# Altium project RP2040-FPV.PrjPcb
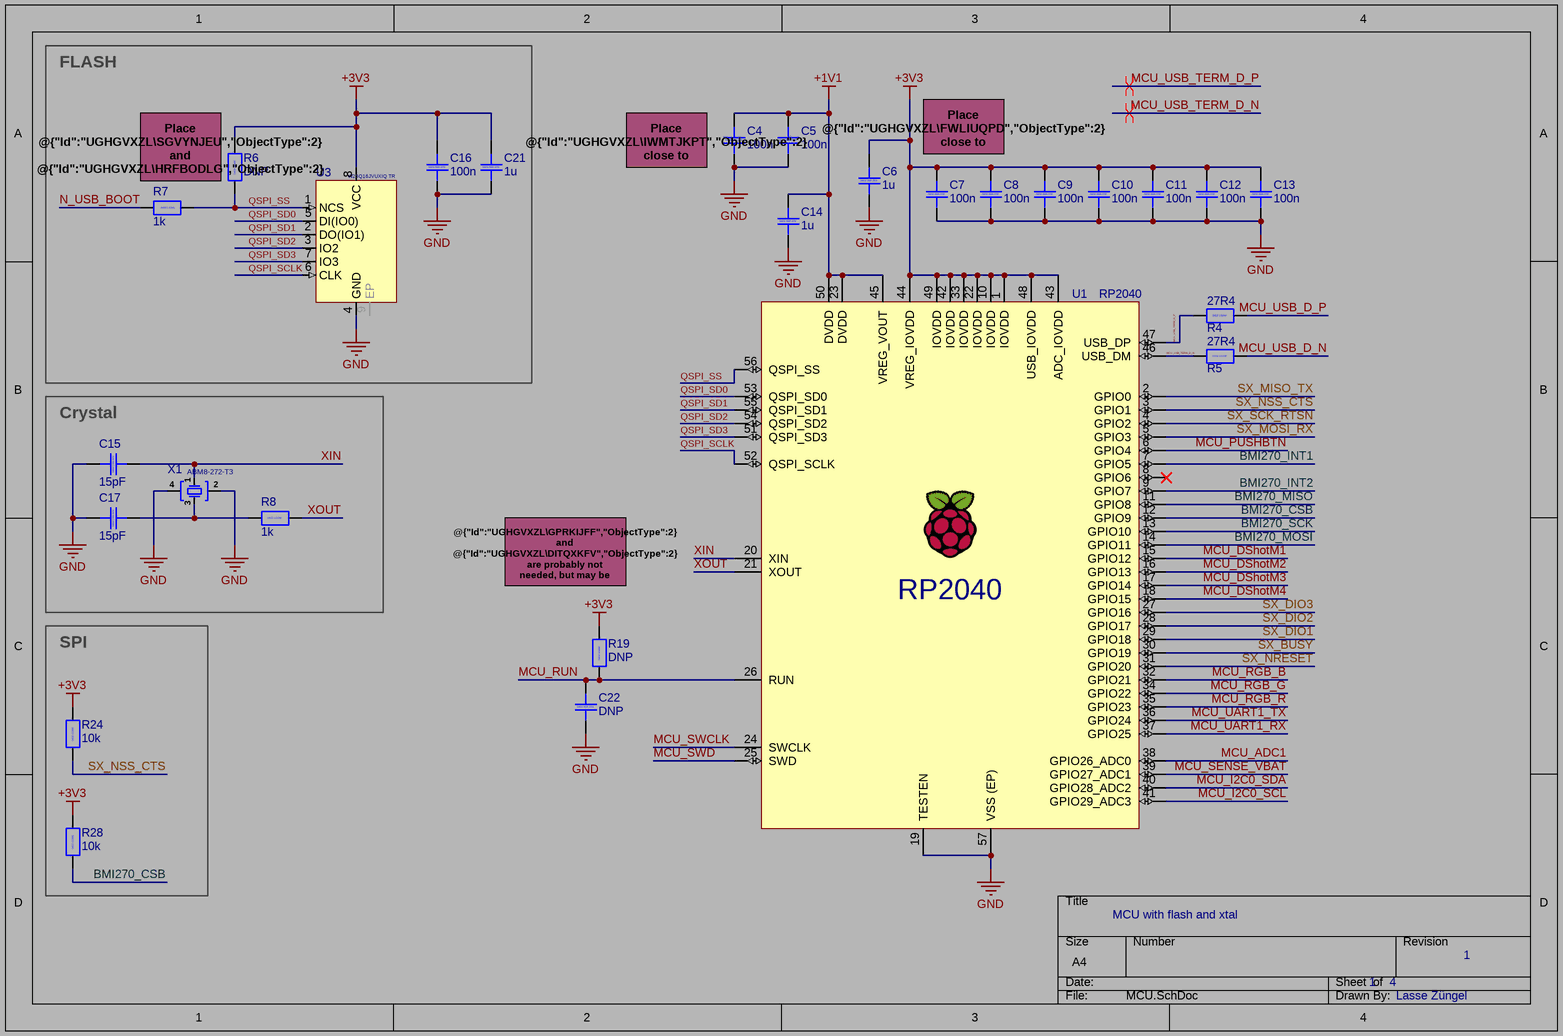
[diagram p0: MCU.SchDoc]
4 sheets, 86 parts. Net scope: global (net labels, ports and power ports of the same name join across sheets).
Board file: PCB.PcbDoc
Sheets:
  MCU.SchDoc
  Interfacing.SchDoc
  Power.SchDoc
  RF.SchDoc

## Sheet MCU.SchDoc
size A4; SheetNumber: 1; SheetTotal: 4

### Parts
C4  100n  [CAP_0402]
C5  100n  [CAP_0402]
C6  1u  [CAP_0402]
C7  100n  [CAP_0402]
C8  100n  [CAP_0402]
C9  100n  [CAP_0402]
C10  100n  [CAP_0402]
C11  100n  [CAP_0402]
C12  100n  [CAP_0402]
C13  100n  [CAP_0402]
C14  1u  [CAP_0402]
C15  15pF  [CAP_0402]
C16  100n  [CAP_0402]
C17  15pF  [CAP_0402]
C21  1u  [CAP_0402]
C22  DNP  [CAP_0402]
R4  27R4  [RES_0402]
R5  27R4  [RES_0402]
R6  DNP  [RES_0402]
R7  1k  [RES_0402]
R8  1k  [RES_0402]
R19  DNP  [RES_0402]
R24  10k  [RES_0402]
R28  10k  [RES_0402]
U1  RP2040  [QFN56 7x7 RP2040]
U3  W25Q16JVUXIQ TR  [USON-8 - 2x3]
X1  ABM8-272-T3  [ABM8-272-T3]

### Blocks framed on the sheet
FLASH: C16 C21 R6 R7 U3
Crystal: C15 C17 R8 X1
SPI: R24 R28

### Nets
+1V1: C4.2 C5.2 C14.2 U1.23(DVDD) U1.45(VREG_VOUT) U1.50(DVDD)
+3V3: C6.2 C7.2 C8.2 C9.2 C10.2 C11.2 C12.2 C13.2 C16.2 C21.2 R6.2 R19.2 R24.2 R28.2 U1.1(IOVDD) U1.10(IOVDD) U1.22(IOVDD) U1.33(IOVDD) U1.42(IOVDD) U1.43(ADC_IOVDD) U1.44(VREG_IOVDD) U1.48(USB_IOVDD) U1.49(IOVDD) U3.8(VCC)
GND: C4.1 C5.1 C6.1 C7.1 C8.1 C9.1 C10.1 C11.1 C12.1 C13.1 C14.1 C15.2 C16.1 C17.2 C21.1 C22.1 U1.19(TESTEN) U1.57(VSS_(EP)) U3.4(GND) X1.2 X1.4
BMI270_CSB: R28.1 U1.12(GPIO9)
BMI270_INT1: U1.7(GPIO5)
BMI270_INT2: U1.9(GPIO7)
BMI270_MISO: U1.11(GPIO8)
BMI270_MOSI: U1.14(GPIO11)
BMI270_SCK: U1.13(GPIO10)
MCU_ADC1: U1.38(GPIO26_ADC0)
MCU_DShotM1: U1.15(GPIO12)
MCU_DShotM2: U1.16(GPIO13)
MCU_DShotM3: U1.17(GPIO14)
MCU_DShotM4: U1.18(GPIO15)
MCU_I2C0_SCL: U1.41(GPIO29_ADC3)
MCU_I2C0_SDA: U1.40(GPIO28_ADC2)
MCU_PUSHBTN: U1.6(GPIO4)
MCU_RGB_B: U1.32(GPIO21)
MCU_RGB_G: U1.34(GPIO22)
MCU_RGB_R: U1.35(GPIO23)
MCU_RUN: C22.2 R19.1 U1.26(RUN)
MCU_SENSE_VBAT: U1.39(GPIO27_ADC1)
MCU_SWCLK: U1.24(SWCLK)
MCU_SWD: U1.25(SWD)
MCU_UART1_RX: U1.37(GPIO25)
MCU_UART1_TX: U1.36(GPIO24)
MCU_USB_D_N: R5.2
MCU_USB_D_P: R4.2
MCU_USB_TERM_D_N: R5.1 U1.46(USB_DM)
MCU_USB_TERM_D_P: R4.1 U1.47(USB_DP)
N_USB_BOOT: R7.2
QSPI_SCLK: U1.52(QSPI_SCLK) U3.6(CLK)
QSPI_SD0: U1.53(QSPI_SD0) U3.5(DI(IO0))
QSPI_SD1: U1.55(QSPI_SD1) U3.2(DO(IO1))
QSPI_SD2: U1.54(QSPI_SD2) U3.3(IO2)
QSPI_SD3: U1.51(QSPI_SD3) U3.7(IO3)
QSPI_SS: R6.1 R7.1 U1.56(QSPI_SS) U3.1(NCS)
SX_BUSY: U1.30(GPIO19)
SX_DIO1: U1.29(GPIO18)
SX_DIO2: U1.28(GPIO17)
SX_DIO3: U1.27(GPIO16)
SX_MISO_TX: U1.2(GPIO0)
SX_MOSI_RX: U1.5(GPIO3)
SX_NRESET: U1.31(GPIO20)
SX_NSS_CTS: R24.1 U1.3(GPIO1)
SX_SCK_RTSN: U1.4(GPIO2)
XIN: C15.1 U1.20(XIN) X1.1
XOUT: R8.2 U1.21(XOUT)
NetC17_1: C17.1 R8.1 X1.3

Not connected (* = marked no-connect by the designer): U1 8(GPIO6)*; U3 9(EP)

### Layout directives
differential pair; differential pair class DIFFPAIRUSBMCU: MCU_USB_TERM_D_N, MCU_USB_TERM_D_P

### Notes on the sheet
- (near R6) Place @{"Id":"UGHGVXZL\SGVYNJEU","ObjectType":2} and @{"Id":"UGHGVXZL\HRFBODLG","ObjectType":2} close to @{"Id":"UGHGVXZL\OZXAQZFD","ObjectType":2} pin 1.
- (near C4) Place @{"Id":"UGHGVXZL\IWMTJKPT","ObjectType":2} close to @{"Id":"UGHGVXZL\TVPMBQHX","ObjectType":2} pin 45.
- Place @{"Id":"UGHGVXZL\FWLIUQPD","ObjectType":2} close to @{"Id":"UGHGVXZL\TVPMBQHX","ObjectType":2} pin 44.
- @{"Id":"UGHGVXZL\GPRKIJFF","ObjectType":2} and @{"Id":"UGHGVXZL\DITQXKFV","ObjectType":2} are probably not needed, but may be added in case of spurrious resets.
- MCU with flash and xtal
- 1    4
- 1
- Lasse Züngel
- (in symbol CAP_0402_C0G_50V) 0402 C0G 50V
- (in symbol CAP_0402_X5R_25V) 0402 X5R 25V
- (in symbol RES_0402) 0402 1/16W

### Library data of the parts
C4-C14 C16 C21 C22 = CAP_0402_X5R_25V: Capacitor 0402 generic, X5R, 25V
C15 C17 = CAP_0402_C0G_50V: Capacitor 0402 generic, C0G (NP0), 50V
R4-R8 R19 R24 R28 = RES_0402: Resistor 0402 generic, 1/16W
U1 = RP2040: SC0914(13) / ARM Microcontrollers - MCU IC RP2040 (RP2B2) T&R, 3,400 (13" reel) UICC01104
U3 = W25Q16JVUXIQ TR: FLASH - NOR Memory IC 16Mbit SPI - Quad I/O 133 MHz 6 ns 8-USON (2x3)
X1 = ABM8-272-T3: Crystals Ultra Miniature Ceramic SMD Crystal / 12MHz 10pF 30PPM 3.2mm x 2.5mm 50R; ComponentLink1Description: Datasheet; ComponentLink1URL: https://www.mouser.de/datasheet/2/122/ECX_1637B-1633271.pdf; ComponentLink2Description: Product Detail; ComponentLink2URL: https://eu.mouser.com/ProductDetail/ECS/ECS-320-8-37B-CKY-TR?qs=l7cgNqFNU1jF5E15eCxZkA%3D%3D

## Sheet Interfacing.SchDoc
size A4; SheetNumber: 2; SheetTotal: 4
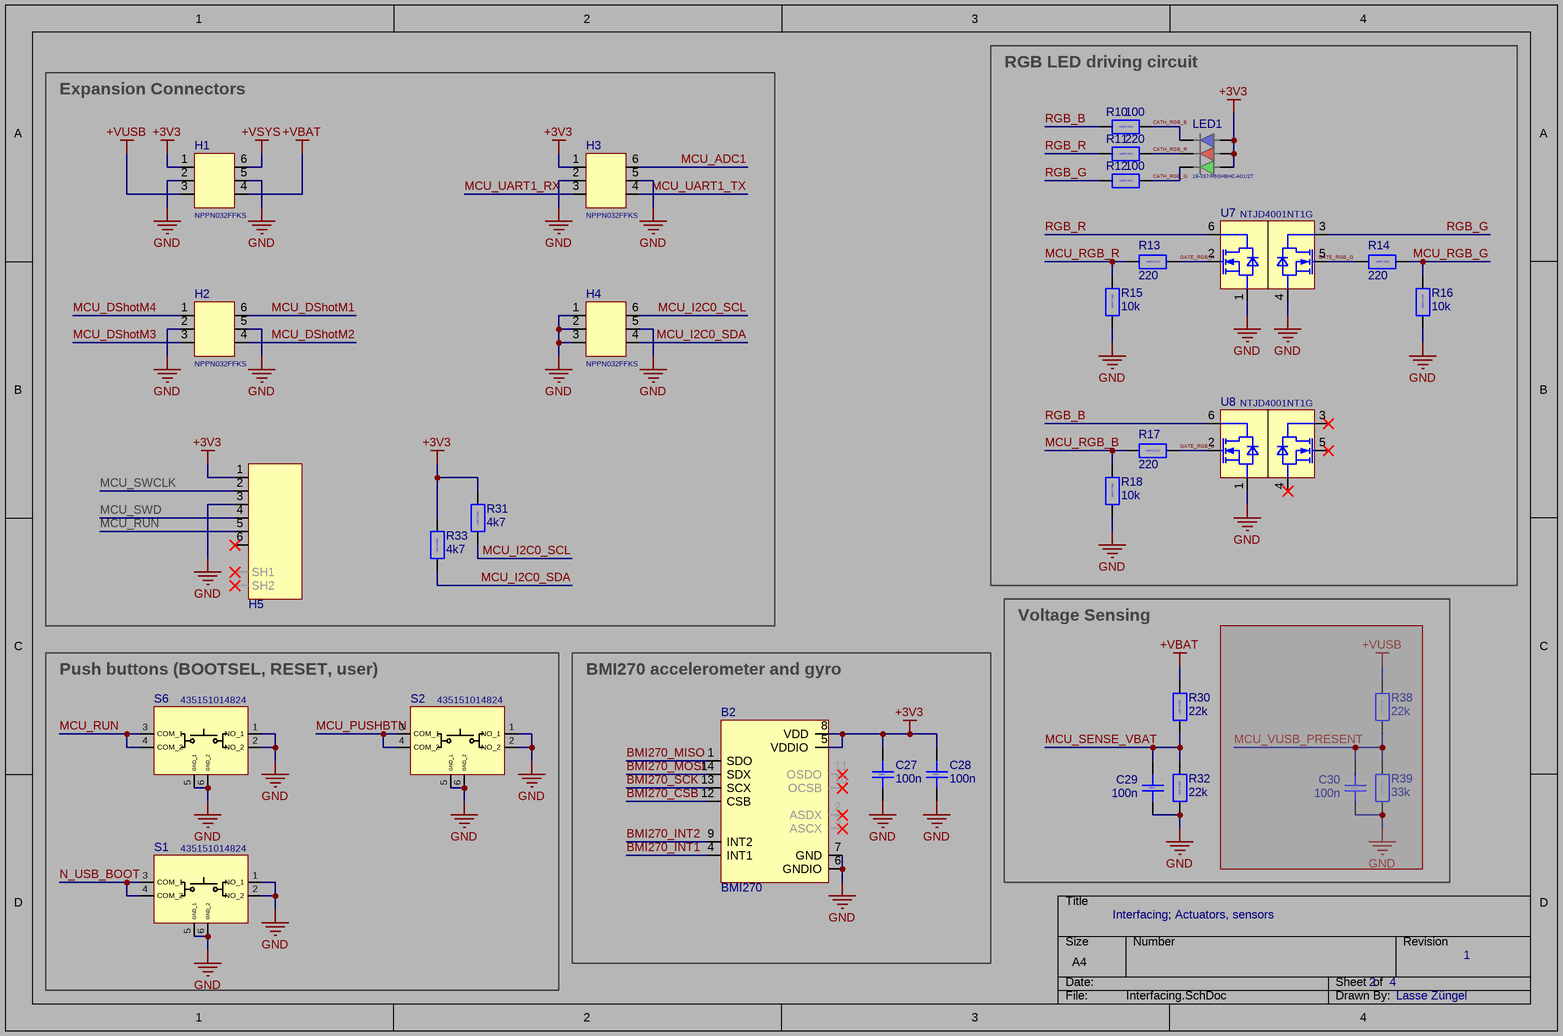
[diagram p1: Interfacing.SchDoc]

### Parts
B2  BMI270  [BMI270]
C27  100n  [CAP_0402]
C28  100n  [CAP_0402]
C29  100n  [CAP_0402]
C30  100n  [CAP_0402]  (masked out: inside a compile mask, not in the netlist)
H1  NPPN032FFKS  [NPPN032FFKS]
H2  NPPN032FFKS  [NPPN032FFKS]
H3  NPPN032FFKS  [NPPN032FFKS]
H4  NPPN032FFKS  [NPPN032FFKS]
H5  AMPHENOL-10147606-00006LF  [AMPHENOL-10147606-00006LF]  (value not drawn)
LED1  19-337/R6GHBHC-A01/2T  [RGB_SMD_1616]
R10  100  [RES_0402]
R11  220  [RES_0402]
R12  100  [RES_0402]
R13  220  [RES_0402]
R14  220  [RES_0402]
R15  10k  [RES_0402]
R16  10k  [RES_0402]
R17  220  [RES_0402]
R18  10k  [RES_0402]
R30  22k  [RES_0402]
R31  4k7  [RES_0402]
R32  22k  [RES_0402]
R33  4k7  [RES_0402]
R38  22k  [RES_0402]  (masked out: inside a compile mask, not in the netlist)
R39  33k  [RES_0402]  (masked out: inside a compile mask, not in the netlist)
S1  435151014824  [435151014824]
S2  435151014824  [435151014824]
S6  435151014824  [435151014824]
U7  NTJD4001NT1G  [SOT363/SC-88]
U8  NTJD4001NT1G  [SOT363/SC-88]

### Blocks framed on the sheet
Expansion Connectors: H1-H5 R31 R33
RGB LED driving circuit: LED1 R10-R18 U7 U8
Voltage Sensing: C29 C30 R30 R32 R38 R39
Push buttons (BOOTSEL, RESET, user): S1 S2 S6
BMI270 accelerometer and gyro: B2 C27 C28

### Nets
+3V3: B2.5(VDDIO) B2.8(VDD) C27.2 C28.2 H1.1 H3.1 H5.1 LED1.4 LED1.5 LED1.6 R31.2 R33.2
+VBAT: H1.4 R30.2
+VSYS: H1.6
+VUSB: H1.3
GND: B2.6(GNDIO) B2.7(GND) C27.1 C28.1 C29.1 H1.2 H1.5 H2.2 H2.5 H3.2 H3.5 H4.1 H4.2 H4.3 H4.5 H5.3 R15.2 R16.2 R18.2 R32.1 S1.1(NO_1) S1.2(NO_2) S1.5(GND_1) S1.6(GND_2) S2.1(NO_1) S2.2(NO_2) S2.5(GND_1) S2.6(GND_2) S6.1(NO_1) S6.2(NO_2) S6.5(GND_1) S6.6(GND_2) U7.1(S1) U7.4(S2) U8.1(S1)
BMI270_CSB: B2.12(CSB)
BMI270_INT1: B2.4(INT1)
BMI270_INT2: B2.9(INT2)
BMI270_MISO: B2.1(SDO)
BMI270_MOSI: B2.14(SDX)
BMI270_SCK: B2.13(SCX)
CATH_RGB_B: LED1.1 R10.1
CATH_RGB_G: LED1.3 R12.1
CATH_RGB_R: LED1.2 R11.1
GATE_RGB_B: R17.2 U8.2(G1)
GATE_RGB_G: R14.2 U7.5(G2)
GATE_RGB_R: R13.2 U7.2(G1)
MCU_ADC1: H3.6
MCU_DShotM1: H2.6
MCU_DShotM2: H2.4
MCU_DShotM3: H2.3
MCU_DShotM4: H2.1
MCU_I2C0_SCL: H4.6 R31.1
MCU_I2C0_SDA: H4.4 R33.1
MCU_PUSHBTN: S2.3(COM_1) S2.4(COM_2)
MCU_RGB_B: R17.1 R18.1
MCU_RGB_G: R14.1 R16.1
MCU_RGB_R: R13.1 R15.1
MCU_RUN: H5.5 S6.3(COM_1) S6.4(COM_2)
MCU_SENSE_VBAT: C29.2 R30.1 R32.2
MCU_SWCLK: H5.2
MCU_SWD: H5.4
MCU_UART1_RX: H3.3
MCU_UART1_TX: H3.4
N_USB_BOOT: S1.3(COM_1) S1.4(COM_2)
RGB_B: R10.2 U8.6(D1)
RGB_G: R12.2 U7.3(D2)
RGB_R: R11.2 U7.6(D1)

Not connected (* = marked no-connect by the designer): B2 2(ASDX)* 3(ASCX)* 10(OCSB)* 11(OSDO)*; H5 6* SH1* SH2*; U8 3(D2)* 4(S2)* 5(G2)*

### Notes on the sheet
- Interfacing; Actuators, sensors
- 2    4
- 1
- Lasse Züngel
- (in symbol CAP_0402) 0402
- (in symbol RES_0402) 0402 1/16W

### Library data of the parts
B2 = BMI270: IMUs - Inertial Measurement Units Smart Ultra-Low Power Inertial Measurement Unit (IMU) for Wearable Applications; Manufacturer_Name: BOSCH; Geometry.Height: 0.87mm; Mouser Part Number: 262-BMI270; Mouser Price/Stock: https://www.mouser.co.uk/ProductDetail/Bosch-Sensortec/BMI270?qs=u16ybLDytRYIj%252BjQEee88A%3D%3D; Manufacturer_Part_Number: BMI270; Datasheet Link: https://www.bosch-sensortec.com/media/boschsensortec/downloads/datasheets/bst-bmi270-ds000.pdf
C27-C30 = CAP_0402: Capacitor 0402 generic
H1-H4 = NPPN032FFKS: CONN HDR 6POS 0.079 GOLD SMD 3x2, 2mm pitch
H5 = AMPHENOL-10147606-00006LF: Amphenol,1mm pitch, 6 Pos, 1 Row, SMD, Wire-to-Board, Right Angle, Male
LED1 = 19-337/R6GHBHC-A01/2T: 0.35mm Height Chip LED with Full Color, Everlight, 1616 SMD; Supplier 1: Digikey; Supplier Part Number 1: 1080-19-337/R6GHBHC-A01/2TCT-ND
R10-R18 R30-R33 R38 R39 = RES_0402: Resistor 0402 generic, 1/16W
S1 S2 S6 = 435151014824: Switch normally open (NO); Manufacturer_Name: Wurth Elektronik; Datasheet Link: https://componentsearchengine.com/Datasheets/2/435151014824.pdf; Height: 1.4mm; Manufacturer_Part_Number: 435151014824; Mouser Part Number: 710-435151014824; Mouser Price/Stock: https://www.mouser.co.uk/ProductDetail/Wurth-Elektronik/435151014824?qs=OlC7AqGiEDkCCtReGm3ZVw%3D%3D
U7 U8 = NTJD4001NT1G: MOSFETs 30V 250mA Dual N-Channel

## Sheet Power.SchDoc
size A4; SheetNumber: 3; SheetTotal: 4
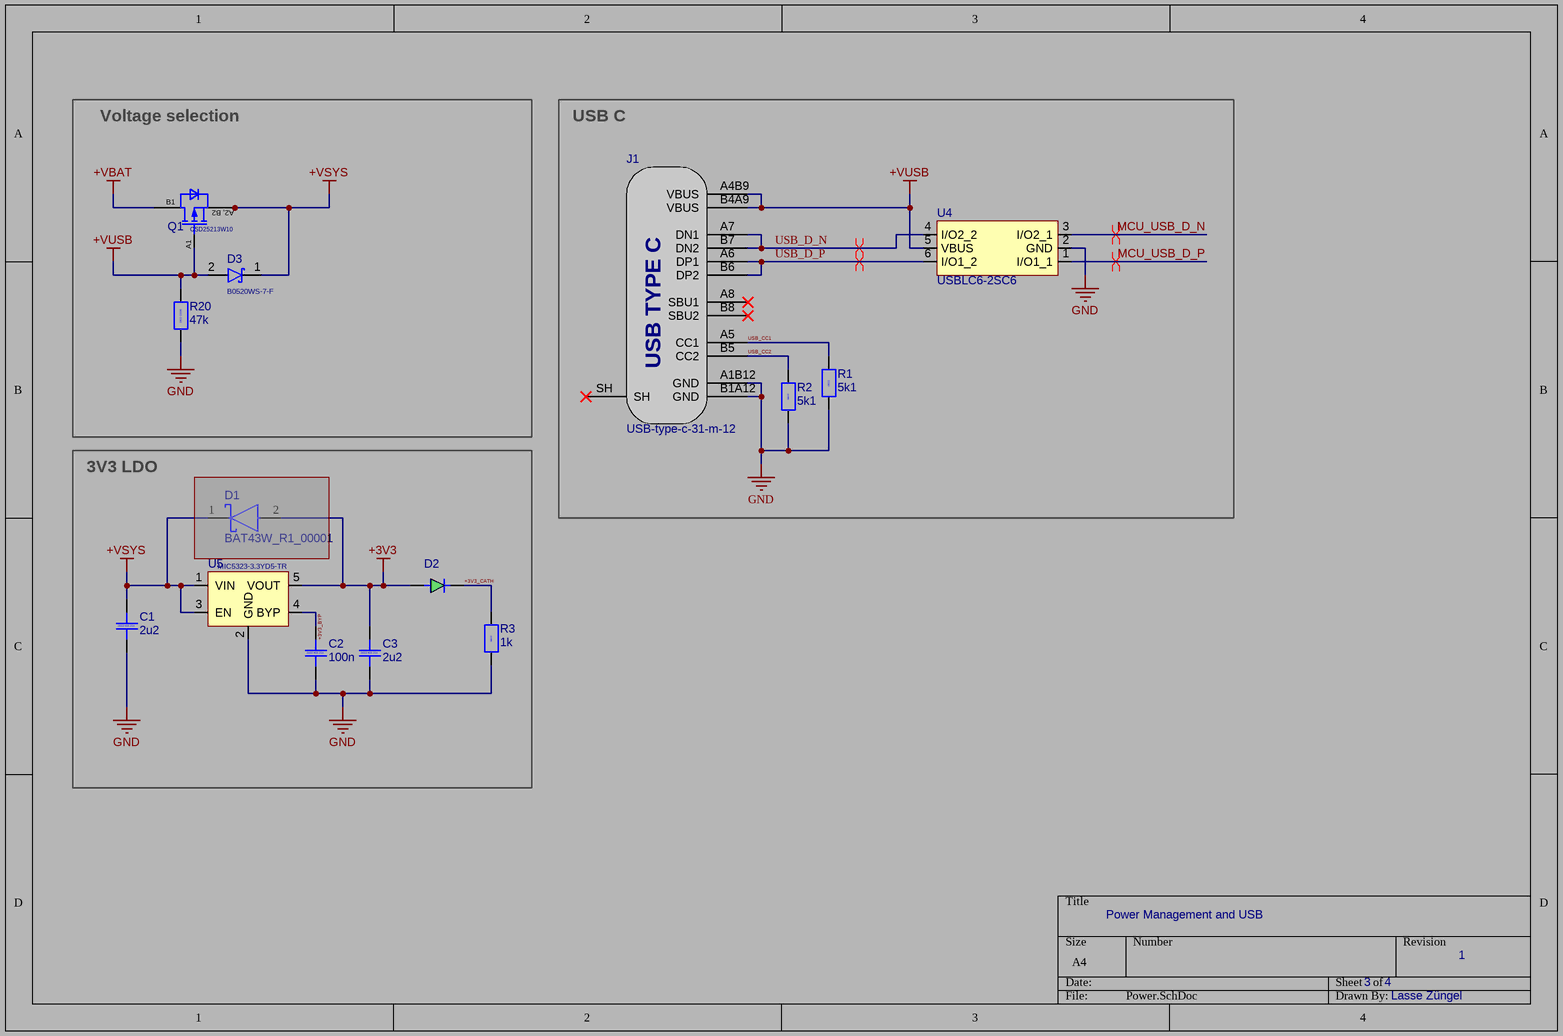
[diagram p2: Power.SchDoc]

### Parts
C1  2u2  [CAP_0603_L]
C2  100n  [CAP_0402]
C3  2u2  [CAP_0603_L]
D1  BAT43W_R1_00001  [SOD123]  (masked out: inside a compile mask, not in the netlist)
D2  SMD_LED_0603  [SMD_LED_0603]  (value not drawn)
D3  B0520WS-7-F  [SOD323]
J1  USB-type-c-31-m-12  [USB-type-c-31-m-12]
Q1  CSD25213W10  [CSD25213W10]
R1  5k1  [RES_0603]
R2  5k1  [RES_0603]
R3  1k  [RES_0603]
R20  47k  [RES_0402]
U4  USBLC6-2SC6  [SOT95P280X145-6N]
U5  MIC5323-3.3YD5-TR  [SPX3819M5-L-3-3/TR]

### Blocks framed on the sheet
Voltage selection: D3 Q1 R20
USB C: J1 R1 R2 U4
3V3 LDO: C1-C3 D1 D2 R3 U5

### Nets
+3V3: C3.2 D2.1 U5.5(VOUT)
+VBAT: Q1.B1(Drain)
+VSYS: C1.2 D3.1 Q1.A2(Source) Q1.B2(Source) U5.1(VIN) U5.3(EN)
+VUSB: D3.2 J1.A4B9(VBUS) J1.B4A9(VBUS) Q1.A1(Gate) R20.2 U4.5(VBUS)
GND: C1.1 C2.1 C3.1 J1.A1B12(GND) J1.B1A12(GND) R1.1 R2.1 R3.1 R20.1 U4.2(GND) U5.2(GND)
+3V3_BYP: C2.2 U5.4(BYP)
+3V3_CATH: D2.2 R3.2
MCU_USB_D_N: U4.3(I/O2_1)
MCU_USB_D_P: U4.1(I/O1_1)
USB_CC1: J1.A5(CC1) R1.2
USB_CC2: J1.B5(CC2) R2.2
USB_D_N: J1.A7(DN1) J1.B7(DN2) U4.4(I/O2_2)
USB_D_P: J1.A6(DP1) J1.B6(DP2) U4.6(I/O1_2)

Not connected (* = marked no-connect by the designer): J1 A8(SBU1)* B8(SBU2)* SH*

### Layout directives
differential pair: USB_D_N, USB_D_P
differential pair; differential pair class DIFFPAIRUSBMCU: MCU_USB_D_N, MCU_USB_D_P

### Notes on the sheet
- Power Management and USB
- 3    4
- 1
- Lasse Züngel
- (in symbol CAP_0402_X5R_25V) 0402 X5R 25V
- (in symbol CAP_0603_X5R_25V) 0603 X5R 25V
- (in symbol CSD25213W10) A2, B2
- (in symbol RES_0402) 0402 1/16W
- (in symbol RES_0603) 0603
- (in symbol USB-type-c-31-m-12) USB TYPE C

### Library data of the parts
C1 C3 = CAP_0603_X5R_25V: Capacitor 0603 generic, X5R, 25V
C2 = CAP_0402_X5R_25V: Capacitor 0402 generic, X5R, 25V
D1 = BAT43W_R1_00001: Schottky Diodes & Rectifiers 30V,Schottky,SOD-123,0.2A; Supplier Part Number 1: 3757-BAT43W_R1_00001CT-ND; Supplier 1: Digikey
D3 = B0520WS-7-F: DIODE SCHOTTKY 20V 500MA SOD323
Q1 = CSD25213W10: -20-V, P channel NexFET™ power MOSFET, single WLP 1 mm x 1 mm, 47 mOhm, gate ESD protection; MPN: CSD25213W10
R1-R3 = RES_0603: Resistor 0603 generic
R20 = RES_0402: Resistor 0402 generic, 1/16W
U4 = USBLC6-2SC6: ESD Protection Diodes / TVS Diodes ESD Protection Low Cap; Manufacturer_Name: STMicroelectronics; Datasheet Link: http://www.st.com/st-web-ui/static/active/en/resource/technical/document/datasheet/CD00050750.pdf; Height: 1.45mm; Manufacturer_Part_Number: USBLC6-2SC6; Mouser Part Number: 511-USBLC6-2SC6; Mouser Price/Stock: https://www.mouser.co.uk/ProductDetail/STMicroelectronics/USBLC6-2SC6?qs=po45yt2pPpu%2FhNIlwQdTlg%3D%3D; Arrow Part Number: USBLC6-2SC6; Arrow Price/Stock: https://www.arrow.com/en/products/usblc6-2sc6/stmicroelectronics?region=nac
U5 = MIC5323-3.3YD5-TR: LDO Voltage Regulators 300mA uCap ULDO High PSRR Low Noise Regulator

## Sheet RF.SchDoc
size A4; SheetNumber: 4; SheetTotal: 4
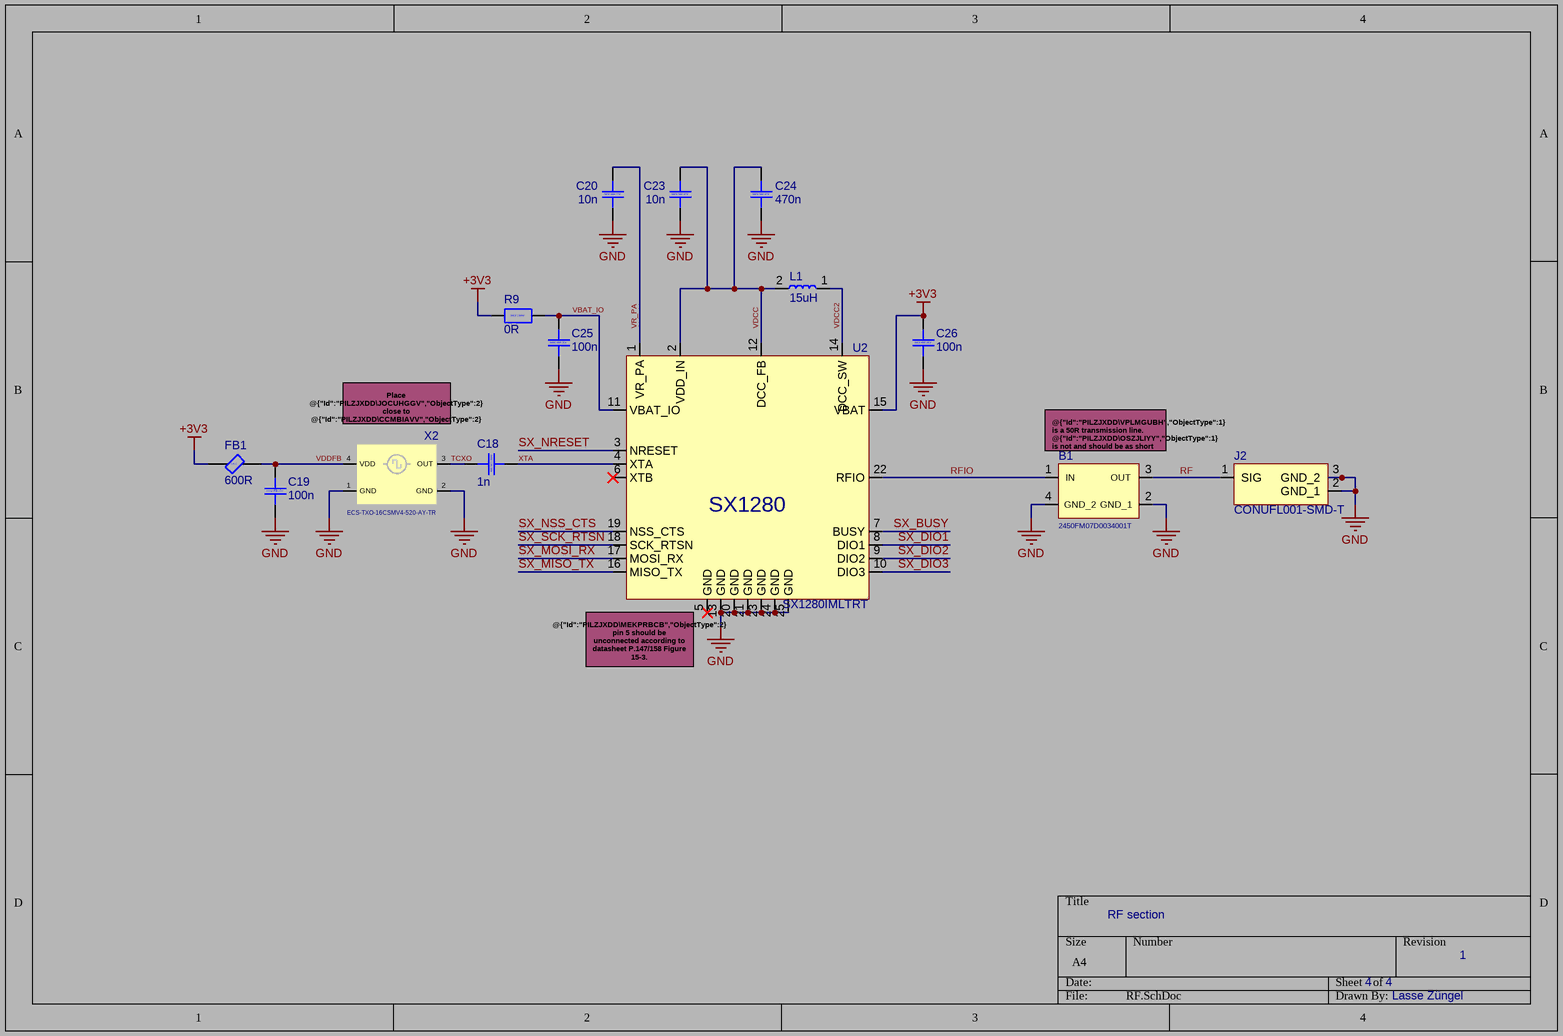
[diagram p3: RF.SchDoc]

### Parts
B1  2450FM07D0034001T  [2450FM07D0034001T]
C18  1n  [CAP_0402]
C19  100n  [CAP_0402]
C20  10n  [CAP_0402]
C23  10n  [CAP_0402]
C24  470n  [CAP_0402]
C25  100n  [CAP_0402]
C26  100n  [CAP_0402]
FB1  600R  [FB_0402]
J2  CONUFL001-SMD-T  [CONUFL001SMDT]
L1  15uH  [INDUCTOR_0805]
R9  0R  [RES_0402]
U2  SX1280IMLTRT  [SX1280IMLTRT]
X2  ECS-TXO-16CSMV4-520-AY-TR  [ECS-TXO-16CSMV4-520-AY-TR]

### Nets
+3V3: C26.2 FB1.1 R9.1 U2.15(VBAT)
GND: B1.2(GND_1) B1.4(GND_2) C19.1 C20.1 C23.1 C24.1 C25.1 C26.1 J2.2(GND_1) J2.3(GND_2) U2.13(GND) U2.20(GND) U2.21(GND) U2.23(GND) U2.24(GND) U2.25(GND) X2.1(GND) X2.2(GND)
RF: B1.3(OUT) J2.1(SIG)
RFIO: B1.1(IN) U2.22(RFIO)
SX_BUSY: U2.7(BUSY)
SX_DIO1: U2.8(DIO1)
SX_DIO2: U2.9(DIO2)
SX_DIO3: U2.10(DIO3)
SX_MISO_TX: U2.16(MISO_TX)
SX_MOSI_RX: U2.17(MOSI_RX)
SX_NRESET: U2.3(NRESET)
SX_NSS_CTS: U2.19(NSS_CTS)
SX_SCK_RTSN: U2.18(SCK_RTSN)
TCXO: C18.1 X2.3(OUT)
VBAT_IO: C25.2 R9.2 U2.11(VBAT_IO)
VDCC: C23.2 C24.2 L1.2 U2.2(VDD_IN) U2.12(DCC_FB)
VDCC2: L1.1 U2.14(DCC_SW)
VDDFB: C19.2 FB1.2 X2.4(VDD)
VR_PA: C20.2 U2.1(VR_PA)
XTA: C18.2 U2.4(XTA)

Not connected (* = marked no-connect by the designer): U2 5(GND)* 6(XTB)*

### Notes on the sheet
- Place @{"Id":"PILZJXDD\JOCUHGGV","ObjectType":2} close to @{"Id":"PILZJXDD\CCMBIAVV","ObjectType":2} and keep @{"Id":"PILZJXDD\STLIQMNA","ObjectType":1}-@{"Id":"PILZJXDD\JOCUHGGV","ObjectType":2}-@{"Id":"PILZJXDD\QAPVDKUX","ObjectType":1} path short.
- (near B1) @{"Id":"PILZJXDD\VPLMGUBH","ObjectType":1} is a 50R transmission line.
  @{"Id":"PILZJXDD\OSZJLIYY","ObjectType":1} is not and should be as short as possible.
- (near U2) @{"Id":"PILZJXDD\MEKPRBCB","ObjectType":2} pin 5 should be unconnected according to datasheet P.147/158 Figure 15-3.
- RF section
- 4    4
- 1
- Lasse Züngel
- (in symbol CAP_0402_C0G_50V) 0402 C0G 50V
- (in symbol CAP_0402_X5R_25V) 0402 X5R 25V
- (in symbol FB_0402) 0402
- (in symbol RES_0402) 0402 1/16W
- (in symbol SX1280IMLTRT) SX1280

### Library data of the parts
B1 = 2450FM07D0034001T: 2.45GHz Impedance Matched Low Pass Filter Optimized for Semtech SX1280 and SX1281 chipsets; Manufacturer_Name: JOHANSON TECHNOLOGY; Geometry.Height: 0.4mm; Mouser Part Number: 609-2450FM07D0034001; Mouser Price/Stock: https://www.mouser.co.uk/ProductDetail/Johanson-Technology/2450FM07D0034001T?qs=jRuttqqUwMRfALoCk7O%252Bzw%3D%3D; Manufacturer_Part_Number: 2450FM07D0034001T; Datasheet Link: https://www.digikey.com/en/products/detail/johanson-technology-inc/2450FM07D0034001T/9477815
C18 = CAP_0402_C0G_50V: Capacitor 0402 generic, C0G (NP0), 50V
C19 C20 C23-C26 = CAP_0402_X5R_25V: Capacitor 0402 generic, X5R, 25V
FB1 = FB_0402: Ferrite bead 0402 generic; MPN: BLM15AG601SN1D
J2 = CONUFL001-SMD-T: RF Connectors / Coaxial Connectors T&R U.FL Straight Surface Mount Jack; Manufacturer_Name: TE Connectivity; Geometry.Height: 1.3mm; Mouser Part Number: N/A; Mouser Price/Stock: https://www.mouser.co.uk/ProductDetail/TE-Connectivity/CONUFL001-SMD-T?qs=3Rah4i%252BhyCHmRzMH%252BkLkPQ%3D%3D; Manufacturer_Part_Number: CONUFL001-SMD-T; Datasheet Link: *
L1 = MLZ2012M150WT000: Power Inductors - SMD 15 UH 20% shielded 250mA; Manufacturer_Name: TDK; Datasheet Link: https://product.tdk.com/system/files/dam/doc/product/inductor/inductor/smd/catalog/inductor_commercial_decoupling_mlz2012_en.pdf; Height: 1.25mm; Manufacturer_Part_Number: MLZ2012M150WT000; Mouser Part Number: 810-MLZ2012M150WT000; Mouser Price/Stock: https://www.mouser.co.uk/ProductDetail/Murata-Electronics/LQW15AN2N2G80D?qs=QzBtWTOodeXwqmhCVrS0ZQ%3D%3D; Arrow Part Number: LQW15AN2N2G80D; Arrow Price/Stock: https://www.arrow.com/en/products/lqw15an2n2g80d/murata-manufacturing
R9 = RES_0402: Resistor 0402 generic, 1/16W
U2 = SX1280IMLTRT: RF Transceiver Long range 2.4 GHz Wireless Transceiver
X2 = ECS-TXO-16CSMV4-520-AY-TR: TCXO Oscillators 52.000 MHz MultiVolt TCXO Clipped Sine Wave 1.7 - 3.6 0.5 ppm -30 - +85C 1.6 x 1.2 mm 4 Pad SM; M: ECS; MPN: ECS-TXO-16CSMV4-520-AY-TR

## Nets that join several sheets
+3V3: MCU (24 pins), Interfacing (12 pins), Power (C3.2 D2.1 U5.5), RF (C26.2 FB1.1 R9.1 U2.15)
+VBAT: Interfacing (H1.4 R30.2), Power (Q1.B1)
+VSYS: Interfacing (H1.6), Power (6 pins)
+VUSB: Interfacing (H1.3), Power (6 pins)
GND: MCU (21 pins), Interfacing (35 pins), Power (11 pins), RF (18 pins)
BMI270_CSB: MCU (R28.1 U1.12), Interfacing (B2.12)
BMI270_INT1: MCU (U1.7), Interfacing (B2.4)
BMI270_INT2: MCU (U1.9), Interfacing (B2.9)
BMI270_MISO: MCU (U1.11), Interfacing (B2.1)
BMI270_MOSI: MCU (U1.14), Interfacing (B2.14)
BMI270_SCK: MCU (U1.13), Interfacing (B2.13)
MCU_ADC1: MCU (U1.38), Interfacing (H3.6)
MCU_DShotM1: MCU (U1.15), Interfacing (H2.6)
MCU_DShotM2: MCU (U1.16), Interfacing (H2.4)
MCU_DShotM3: MCU (U1.17), Interfacing (H2.3)
MCU_DShotM4: MCU (U1.18), Interfacing (H2.1)
MCU_I2C0_SCL: MCU (U1.41), Interfacing (H4.6 R31.1)
MCU_I2C0_SDA: MCU (U1.40), Interfacing (H4.4 R33.1)
MCU_PUSHBTN: MCU (U1.6), Interfacing (S2.3 S2.4)
MCU_RGB_B: MCU (U1.32), Interfacing (R17.1 R18.1)
MCU_RGB_G: MCU (U1.34), Interfacing (R14.1 R16.1)
MCU_RGB_R: MCU (U1.35), Interfacing (R13.1 R15.1)
MCU_RUN: MCU (C22.2 R19.1 U1.26), Interfacing (H5.5 S6.3 S6.4)
MCU_SENSE_VBAT: MCU (U1.39), Interfacing (C29.2 R30.1 R32.2)
MCU_SWCLK: MCU (U1.24), Interfacing (H5.2)
MCU_SWD: MCU (U1.25), Interfacing (H5.4)
MCU_UART1_RX: MCU (U1.37), Interfacing (H3.3)
MCU_UART1_TX: MCU (U1.36), Interfacing (H3.4)
MCU_USB_D_N: MCU (R5.2), Power (U4.3)
MCU_USB_D_P: MCU (R4.2), Power (U4.1)
N_USB_BOOT: MCU (R7.2), Interfacing (S1.3 S1.4)
SX_BUSY: MCU (U1.30), RF (U2.7)
SX_DIO1: MCU (U1.29), RF (U2.8)
SX_DIO2: MCU (U1.28), RF (U2.9)
SX_DIO3: MCU (U1.27), RF (U2.10)
SX_MISO_TX: MCU (U1.2), RF (U2.16)
SX_MOSI_RX: MCU (U1.5), RF (U2.17)
SX_NRESET: MCU (U1.31), RF (U2.3)
SX_NSS_CTS: MCU (R24.1 U1.3), RF (U2.19)
SX_SCK_RTSN: MCU (U1.4), RF (U2.18)